# Altium schematic sheet EXT_FLEX_SENSOR.SchDoc
size A4; SheetNumber: 2; SheetTotal: 4
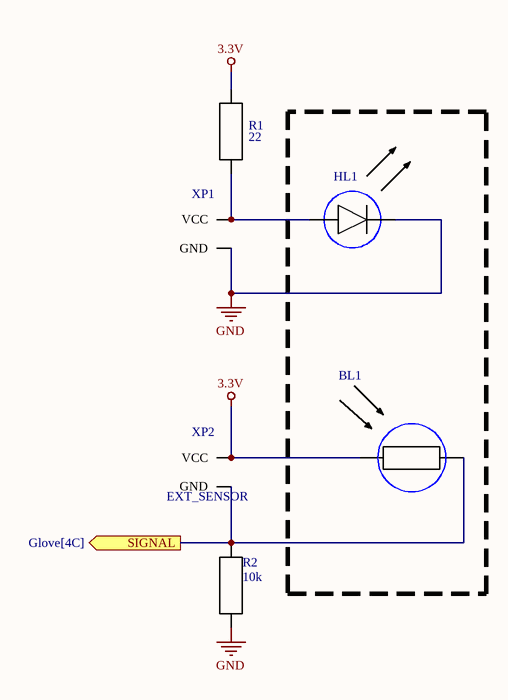
[diagram p0: EXT_FLEX_SENSOR.SchDoc]

## Parts
BL1  (no value)
HL1  (no value)
R1  22  [CAPC2012X145N]
R2  10k  [CAPC2012X145N]
XP1  (no value)  [EXT_SENSOR]
XP2  EXT_SENSOR  [EXT_SENSOR]

## Ports
SIGNAL (out, see Glove[4C])

## Nets
3.3V: BL1.0 R1.2 XP2.1(VCC)
GND: HL1.1 R2.1 XP1.2(GND)
SIGNAL: BL1.1 R2.2 XP2.2(GND) ; port SIGNAL
NetHL1_0: HL1.0 R1.1 XP1.1(VCC)

## Library data of the parts
BL1 = EXTI_PHOTORESISTOR
HL1 = EXTI_LED
R1 R2 = 0805R: Resistor; Manufacturer_Name: SAMSUNG; Manufacturer_Part_Number: CL21A106KAYNNNE; Datasheet Link: https://datasheet.datasheetarchive.com/originals/distributors/Datasheets_SAMA/6a45835c9b7400e9b49c55c38a8ff4a2.pdf; Height: 1.45mm; Mouser Part Number: 187-CL21A106KAYNNNE; Mouser Price/Stock: https://www.mouser.co.uk/ProductDetail/Samsung-Electro-Mechanics/CL21A106KAYNNNE?qs=yOVawPpwOwmTXAd4dJtNjA%3D%3D; Arrow Part Number: CL21A106KAYNNNE; Arrow Price/Stock: https://www.arrow.com/en/products/cl21a106kaynnne/samsung-electro-mechanics?utm_currency=USD&region=nac
XP1 = EXT_SENSOR